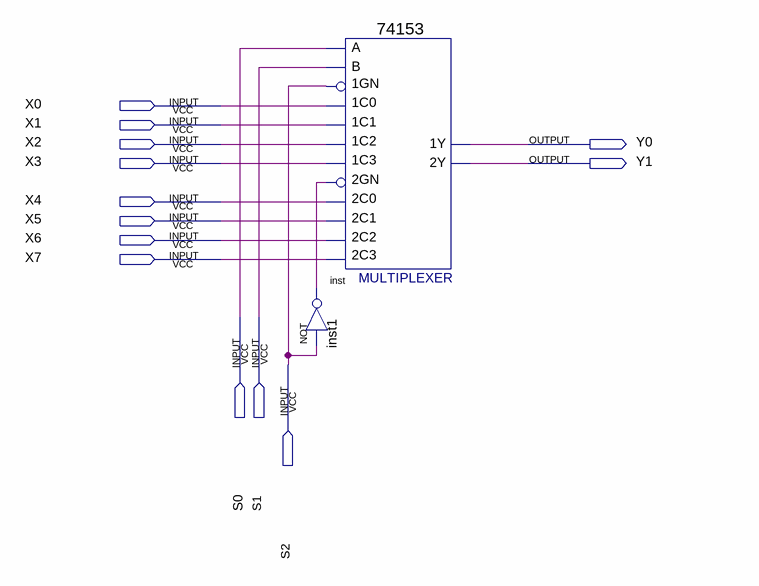
[diagram p0: schematic sheet]
// Quartus schematic MUX2x4_1.bdf as structural Verilog: 2 symbols, 13 pins
module MUX2x4_1 (
  input  X0,
  input  X1,
  input  X2,
  input  X3,
  input  X4,
  input  X5,
  input  X6,
  input  X7,
  input  S0,
  input  S1,
  input  S2,
  output Y0,
  output Y1
);

  wire inst1_out;

  \74153  inst (
    .\1C1 (X1), .\1GN (S2), .\1C0 (X0), .\2C0 (X4), .\2GN (inst1_out), .\2C2 (X6), .\1C2 (X2), .\1C3 (X3),
    .B(S1), .A(S0), .\2C1 (X5), .\2C3 (X7), .\1Y (Y0), .\2Y (Y1));
  not inst1 (inst1_out, S2);
endmodule
